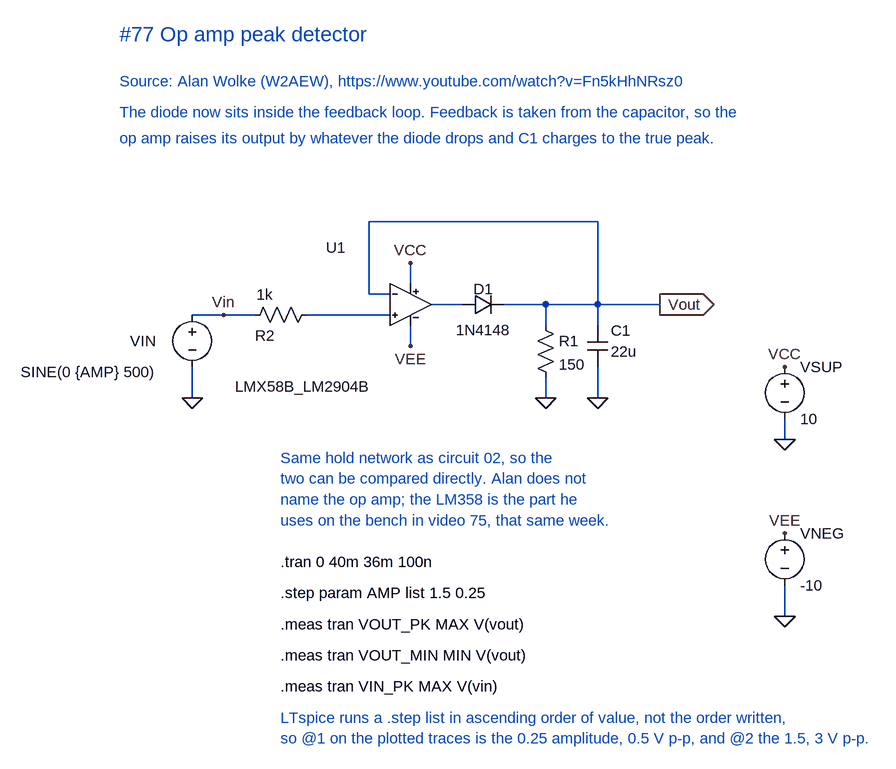
[diagram p0: schematic Op amp peak detector.asc]
Op amp peak detector.asc, the LTspice schematic file:
Version 4.1
SHEET 1 1200 800
WIRE 160 80 64 80
WIRE 368 80 240 80
WIRE 64 208 64 160
WIRE 400 32 400 0
WIRE 400 128 400 96
WIRE 480 64 432 64
WIRE 608 64 544 64
WIRE 688 64 608 64
WIRE 784 64 688 64
WIRE 608 96 608 64
WIRE 608 208 608 176
WIRE 688 96 688 64
WIRE 688 208 688 160
WIRE 688 -64 688 64
WIRE 336 -64 688 -64
WIRE 336 48 336 -64
WIRE 368 48 336 48
WIRE 976 272 976 240
WIRE 976 544 976 496
FLAG 64 208 0
FLAG 400 128 VEE
FLAG 608 208 0
FLAG 688 208 0
FLAG 976 272 0
FLAG 976 416 VEE
FLAG 976 544 0
FLAG 400 0 VCC
FLAG 976 160 VCC
FLAG 784 64 Vout
IOPIN 784 64 Out
FLAG 112 80 Vin
SYMBOL voltage 64 64 R0
WINDOW 123 0 0 Left 0
WINDOW 39 0 0 Left 0
WINDOW 0 -56 56 Right 2
WINDOW 3 -264 104 Left 2
SYMATTR InstName VIN
SYMATTR Value SINE(0 {AMP} 500)
SYMBOL res 144 96 R270
WINDOW 0 0 32 VBottom 2
WINDOW 3 32 32 VTop 2
SYMATTR InstName R2
SYMATTR Value 1k
SYMBOL ..\..\LTspice\Symbols\LMX58B_LM2904B 400 0 R0
WINDOW 0 -130 -24 Left 2
WINDOW 3 -270 190 Left 2
SYMATTR InstName U1
SYMATTR Value LMX58B_LM2904B
SYMBOL diode 480 80 R270
WINDOW 0 24 32 VTop 2
WINDOW 3 -8 32 VBottom 2
SYMATTR InstName D1
SYMATTR Value 1N4148
SYMBOL res 592 80 R0
SYMATTR InstName R1
SYMATTR Value 150
SYMBOL cap 672 96 R0
WINDOW 0 36 8 Left 2
WINDOW 3 36 40 Left 2
SYMATTR InstName C1
SYMATTR Value 22u
SYMBOL voltage 976 400 R0
WINDOW 123 0 0 Left 0
WINDOW 39 0 0 Left 0
SYMATTR InstName VNEG
SYMATTR Value -10
SYMBOL voltage 976 144 R0
WINDOW 123 0 0 Left 0
WINDOW 39 0 0 Left 0
SYMATTR InstName VSUP
SYMATTR Value 10
TEXT -48 -352 Left 3 ;#77 Op amp peak detector
TEXT -48 -280 Left 2 ;Source: Alan Wolke (W2AEW), https://www.youtube.com/watch?v=Fn5kHhNRsz0
TEXT -48 -232 Left 2 ;The diode now sits inside the feedback loop. Feedback is taken from the capacitor, so the
TEXT -48 -192 Left 2 ;op amp raises its output by whatever the diode drops and C1 charges to the true peak.
TEXT 200 300 Left 2 ;Same hold network as circuit 02, so the
TEXT 200 332 Left 2 ;two can be compared directly. Alan does not
TEXT 200 364 Left 2 ;name the op amp; the LM358 is the part he
TEXT 200 396 Left 2 ;uses on the bench in video 75, that same week.
TEXT 200 460 Left 2 !.tran 0 40m 36m 100n
TEXT 200 508 Left 2 !.step param AMP list 1.5 0.25
TEXT 200 556 Left 2 !.meas tran VOUT_PK MAX V(vout)
TEXT 200 604 Left 2 !.meas tran VOUT_MIN MIN V(vout)
TEXT 200 652 Left 2 !.meas tran VIN_PK MAX V(vin)
TEXT 200 700 Left 2 ;LTspice runs a .step list in ascending order of value, not the order written,
TEXT 200 732 Left 2 ;so @1 on the plotted traces is the 0.25 amplitude, 0.5 V p-p, and @2 the 1.5, 3 V p-p.

The netlist it stands for:
* Op amp peak detector.asc
VIN Vin 0 SINE(0 {AMP} 500)
R2 Vin N001 1k
X§U1 N001 Vout VCC VEE N002 LMX58B_LM2904B  ; pins In+ In- V+ V- OUT
D1 N002 Vout 1N4148
R1 Vout 0 150
C1 Vout 0 22u
VNEG VEE 0 -10
VSUP VCC 0 10
.model D D
.lib standard.dio
* #77 Op amp peak detector
* Source: Alan Wolke (W2AEW), https://www.youtube.com/watch?v=Fn5kHhNRsz0
* The diode now sits inside the feedback loop. Feedback is taken from the capacitor, so the
* op amp raises its output by whatever the diode drops and C1 charges to the true peak.
* Same hold network as circuit 02, so the
* two can be compared directly. Alan does not
* name the op amp; the LM358 is the part he
* uses on the bench in video 75, that same week.
.tran 0 40m 36m 100n
.step param AMP list 1.5 0.25
.meas tran VOUT_PK MAX V(vout)
.meas tran VOUT_MIN MIN V(vout)
.meas tran VIN_PK MAX V(vin)
* LTspice runs a .step list in ascending order of value, not the order written,
* so @1 on the plotted traces is the 0.25 amplitude, 0.5 V p-p, and @2 the 1.5, 3 V p-p.
.lib ..\..\LTspice\Models\Texas-Instruments\lmx58b_lm2904b.lib
.backanno
.end